# Altium project BLDC-Driver-v2.0.PrjPcb (part 4 of 4)

## Sheet BLDC-Driver-Sheet.SchDoc
size 420 x 297 mm; SheetNumber: 7; SheetTotal: 7
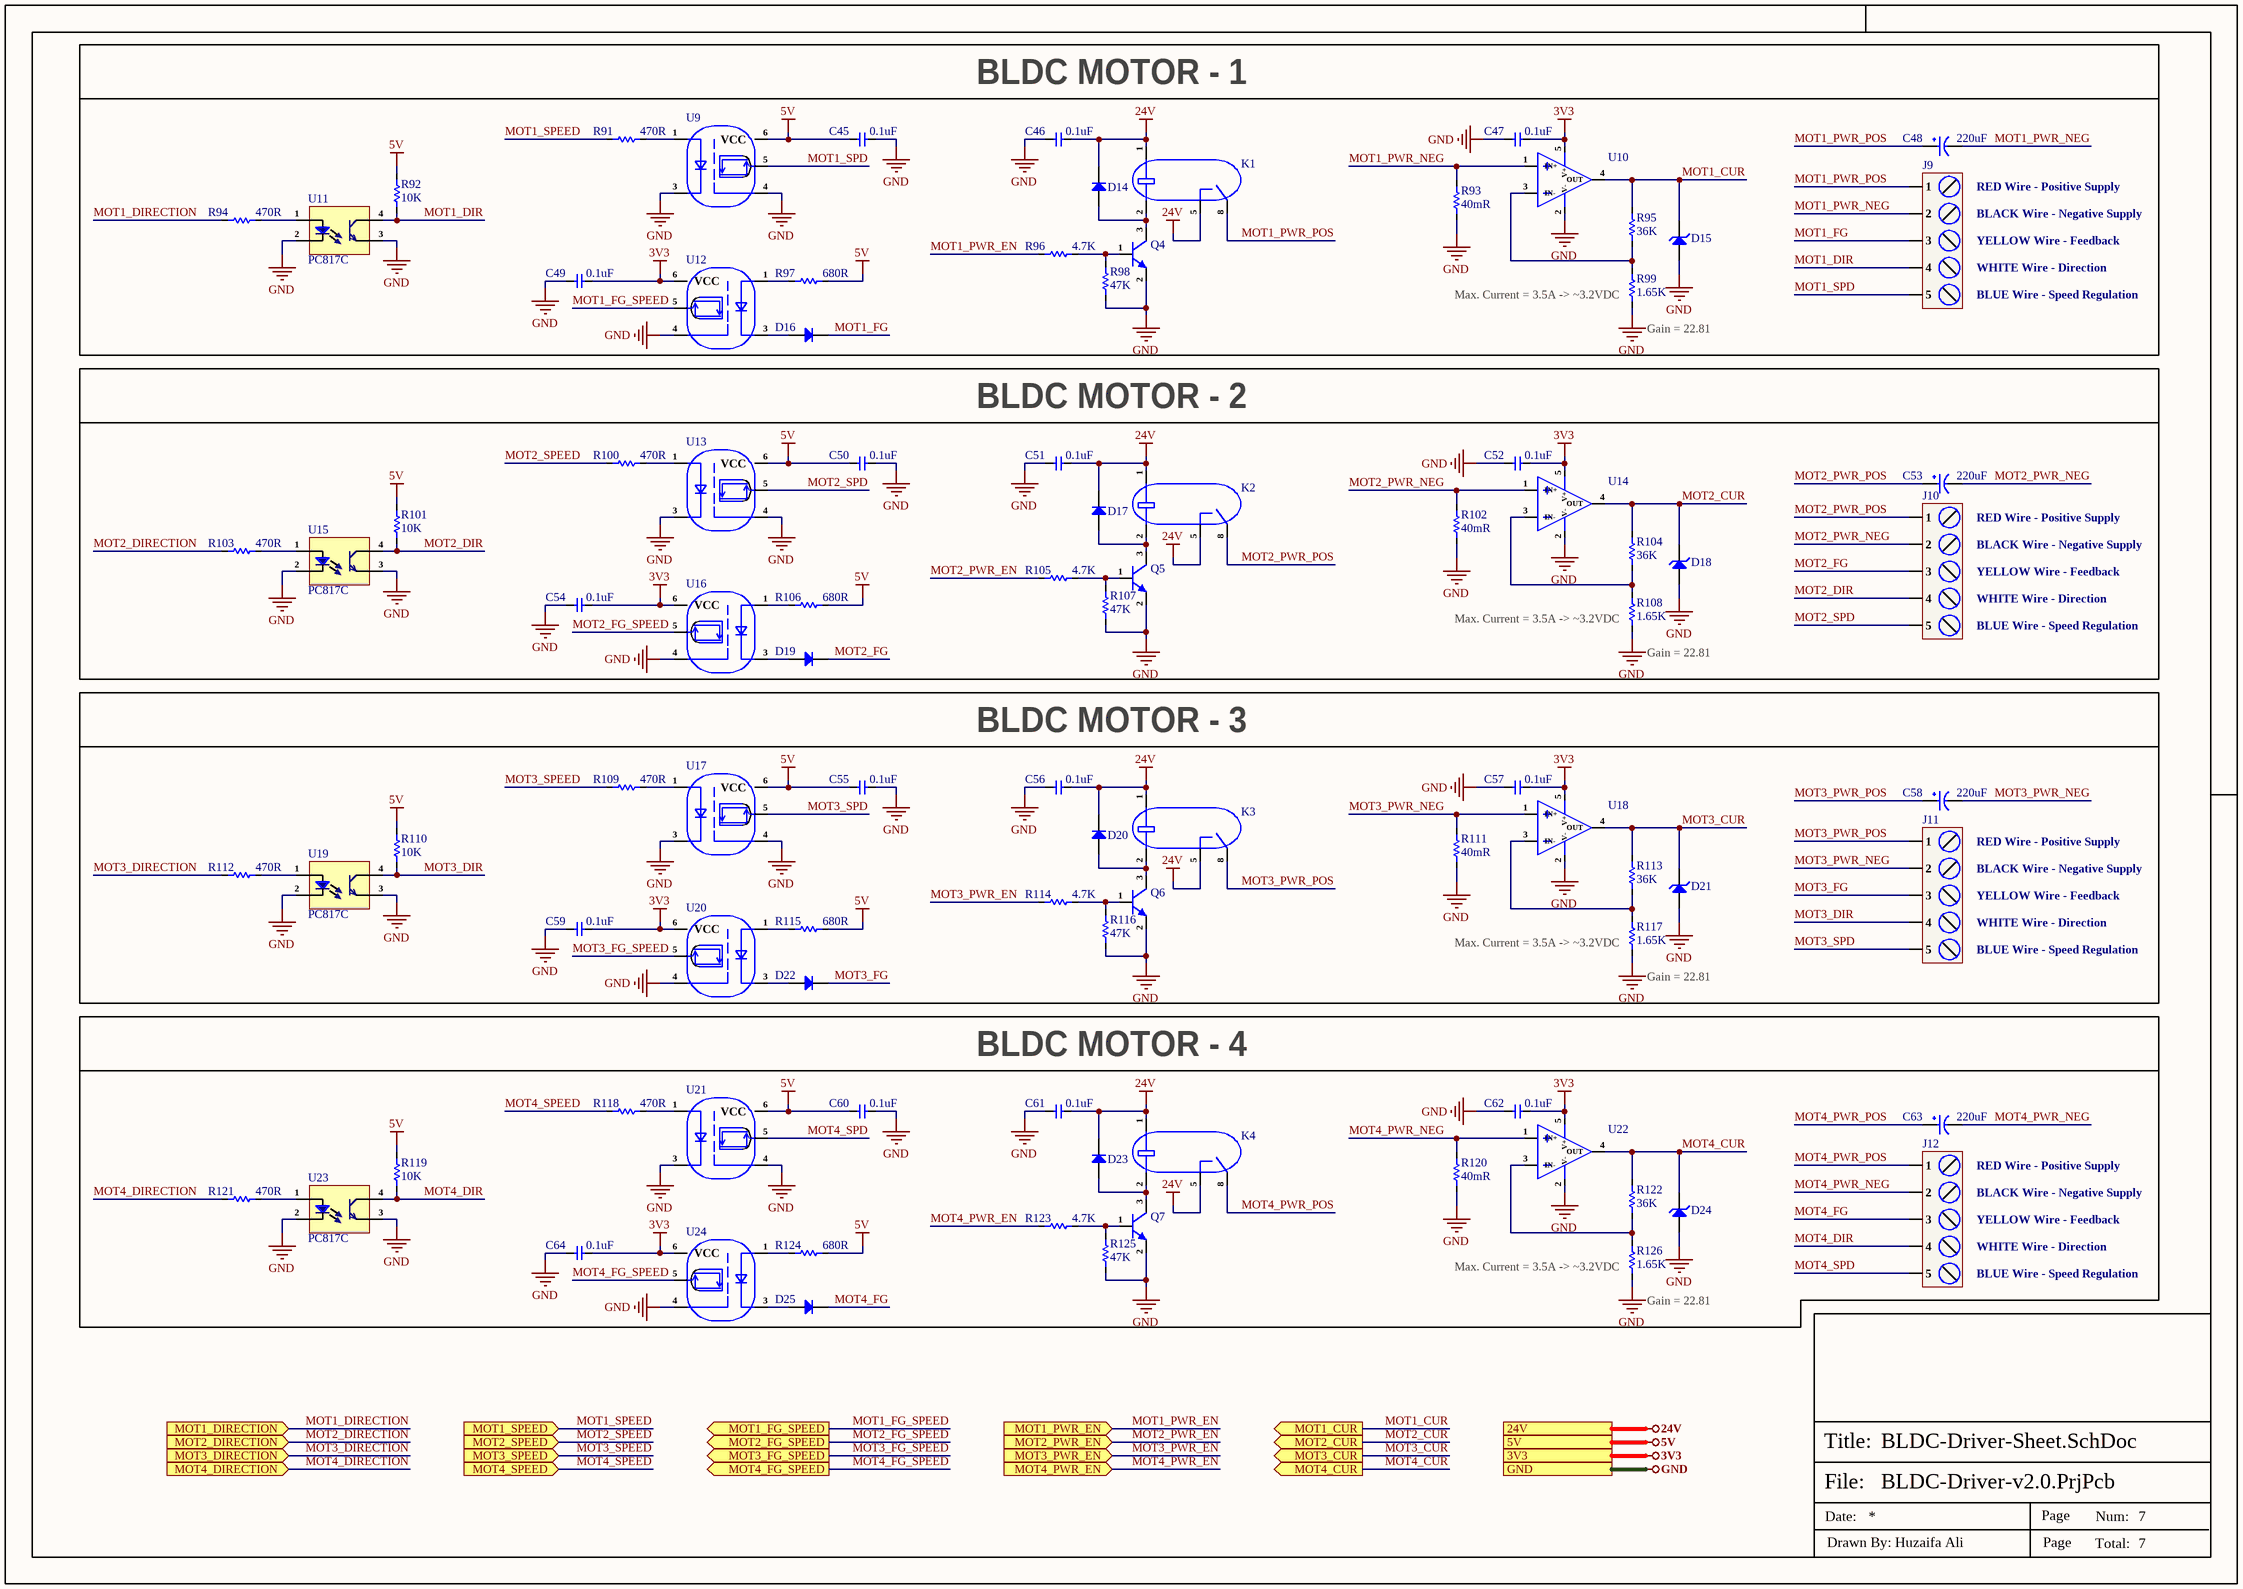
[diagram p6: BLDC-Driver-Sheet.SchDoc]

### Parts
C45  0.1uF  [Cap-0603]
C46  0.1uF  [Cap-0603]
C47  0.1uF  [Cap-0402]
C48  220uF  [SVZ1VM221FBRE00RAXXX]
C49  0.1uF  [Cap-0603]
C50  0.1uF  [Cap-0603]
C51  0.1uF  [Cap-0603]
C52  0.1uF  [Cap-0402]
C53  220uF  [SVZ1VM221FBRE00RAXXX]
C54  0.1uF  [Cap-0603]
C55  0.1uF  [Cap-0603]
C56  0.1uF  [Cap-0603]
C57  0.1uF  [Cap-0402]
C58  220uF  [SVZ1VM221FBRE00RAXXX]
C59  0.1uF  [Cap-0603]
C60  0.1uF  [Cap-0603]
C61  0.1uF  [Cap-0603]
C62  0.1uF  [Cap-0402]
C63  220uF  [SVZ1VM221FBRE00RAXXX]
C64  0.1uF  [Cap-0603]
D14  1N4148WS-7-F  [SOD-323]  (value not drawn)
D15  MM3Z3V3B  [SOD323F]  (value not drawn)
D16  1N4148WS-7-F  [SOD-323]  (value not drawn)
D17  1N4148WS-7-F  [SOD-323]  (value not drawn)
D18  MM3Z3V3B  [SOD323F]  (value not drawn)
D19  1N4148WS-7-F  [SOD-323]  (value not drawn)
D20  1N4148WS-7-F  [SOD-323]  (value not drawn)
D21  MM3Z3V3B  [SOD323F]  (value not drawn)
D22  1N4148WS-7-F  [SOD-323]  (value not drawn)
D23  1N4148WS-7-F  [SOD-323]  (value not drawn)
D24  MM3Z3V3B  [SOD323F]  (value not drawn)
D25  1N4148WS-7-F  [SOD-323]  (value not drawn)
J9  DB128V-5.08-5P-GN-S  [DB128V-5.08-5P-GN-S]  (value not drawn)
J10  DB128V-5.08-5P-GN-S  [DB128V-5.08-5P-GN-S]  (value not drawn)
J11  DB128V-5.08-5P-GN-S  [DB128V-5.08-5P-GN-S]  (value not drawn)
J12  DB128V-5.08-5P-GN-S  [DB128V-5.08-5P-GN-S]  (value not drawn)
K1  G6DN-1A-SLDC24  [G6DN-1A-SL DC24]  (value not drawn)
K2  G6DN-1A-SLDC24  [G6DN-1A-SL DC24]  (value not drawn)
K3  G6DN-1A-SLDC24  [G6DN-1A-SL DC24]  (value not drawn)
K4  G6DN-1A-SLDC24  [G6DN-1A-SL DC24]  (value not drawn)
Q4  MMBT3904T-7-F  [SOT-523]  (value not drawn)
Q5  MMBT3904T-7-F  [SOT-523]  (value not drawn)
Q6  MMBT3904T-7-F  [SOT-523]  (value not drawn)
Q7  MMBT3904T-7-F  [SOT-523]  (value not drawn)
R91  470R  [Res-0402]
R92  10K  [Res-0402]
R93  40mR  [Res-1206]
R94  470R  [Res-0402]
R95  36K  [Res-0402]
R96  4.7K  [Res-0402]
R97  680R  [Res-0402]
R98  47K  [Res-0402]
R99  1.65K  [Res-0402]
R100  470R  [Res-0402]
R101  10K  [Res-0402]
R102  40mR  [Res-1206]
R103  470R  [Res-0402]
R104  36K  [Res-0402]
R105  4.7K  [Res-0402]
R106  680R  [Res-0402]
R107  47K  [Res-0402]
R108  1.65K  [Res-0402]
R109  470R  [Res-0402]
R110  10K  [Res-0402]
R111  40mR  [Res-1206]
R112  470R  [Res-0402]
R113  36K  [Res-0402]
R114  4.7K  [Res-0402]
R115  680R  [Res-0402]
R116  47K  [Res-0402]
R117  1.65K  [Res-0402]
R118  470R  [Res-0402]
R119  10K  [Res-0402]
R120  40mR  [Res-1206]
R121  470R  [Res-0402]
R122  36K  [Res-0402]
R123  4.7K  [Res-0402]
R124  680R  [Res-0402]
R125  47K  [Res-0402]
R126  1.65K  [Res-0402]
U9  TLP2361(TPL,E(T  [SO-5]  (value not drawn)
U10  TLV9001IDCKR  [SC-70-5]  (value not drawn)
U11  PC817C  [PC817C]
U12  TLP2361(TPL,E(T  [SO-5]  (value not drawn)
U13  TLP2361(TPL,E(T  [SO-5]  (value not drawn)
U14  TLV9001IDCKR  [SC-70-5]  (value not drawn)
U15  PC817C  [PC817C]
U16  TLP2361(TPL,E(T  [SO-5]  (value not drawn)
U17  TLP2361(TPL,E(T  [SO-5]  (value not drawn)
U18  TLV9001IDCKR  [SC-70-5]  (value not drawn)
U19  PC817C  [PC817C]
U20  TLP2361(TPL,E(T  [SO-5]  (value not drawn)
U21  TLP2361(TPL,E(T  [SO-5]  (value not drawn)
U22  TLV9001IDCKR  [SC-70-5]  (value not drawn)
U23  PC817C  [PC817C]
U24  TLP2361(TPL,E(T  [SO-5]  (value not drawn)

### Blocks framed on the sheet
BLDC MOTOR - 1: C45-C49 D14-D16 J9 K1 Q4 R91-R99 U9-U12
BLDC MOTOR - 2: C50-C54 D17-D19 J10 K2 Q5 R100-R108 U13-U16
BLDC MOTOR - 3: C55-C59 D20-D22 J11 K3 Q6 R109-R117 U17-U20
BLDC MOTOR - 4: C60-C64 D23-D25 J12 K4 Q7 R118-R126 U21-U24

### Ports
3V3 (see Top-Sheet[1B], Comms-Sheet[4D], Controller-Sheet-1[4D], Controller-Sheet-2[4D], Power-Sheet[4D], USB-Sheet[4D]), 5V (see Top-Sheet[1B], Comms-Sheet[4D], Controller-Sheet-2[4D], Power-Sheet[4D], USB-Sheet[4D]), 24V (see Top-Sheet[1B], Power-Sheet[4D]), GND (see Top-Sheet[1B], Comms-Sheet[4D], Controller-Sheet-1[4D], Controller-Sheet-2[4D], Power-Sheet[4D], USB-Sheet[4D]), MOT1_CUR (out, see Top-Sheet[2B]), MOT1_DIRECTION (in, see Top-Sheet[2B]), MOT1_FG_SPEED (out, see Top-Sheet[2B]), MOT1_PWR_EN (in, see Top-Sheet[2B]), MOT1_SPEED (in, see Top-Sheet[2B]), MOT2_CUR (out, see Top-Sheet[2B]), MOT2_DIRECTION (in, see Top-Sheet[2B]), MOT2_FG_SPEED (out, see Top-Sheet[2B]), MOT2_PWR_EN (in, see Top-Sheet[2B]), MOT2_SPEED (in, see Top-Sheet[2B]), MOT3_CUR (out, see Top-Sheet[2B]), MOT3_DIRECTION (in, see Top-Sheet[2B]), MOT3_FG_SPEED (out, see Top-Sheet[2B]), MOT3_PWR_EN (in, see Top-Sheet[2B]), MOT3_SPEED (in, see Top-Sheet[2B]), MOT4_CUR (out, see Top-Sheet[2B]), MOT4_DIRECTION (in, see Top-Sheet[2B]), MOT4_FG_SPEED (out, see Top-Sheet[2B]), MOT4_PWR_EN (in, see Top-Sheet[2B]), MOT4_SPEED (in, see Top-Sheet[2B])

### Nets
3V3: C47.1 C49.1 C52.1 C54.1 C57.1 C59.1 C62.1 C64.1 U10.5(V+) U12.6(VCC) U14.5(V+) U16.6(VCC) U18.5(V+) U20.6(VCC) U22.5(V+) U24.6(VCC) ; port 3V3
5V: C45.1 C50.1 C55.1 C60.1 R92.2 R97.2 R101.2 R106.2 R110.2 R115.2 R119.2 R124.2 U9.6(VCC) U13.6(VCC) U17.6(VCC) U21.6(VCC) ; port 5V
24V: C46.1 C51.1 C56.1 C61.1 D14.1(K) D17.1(K) D20.1(K) D23.1(K) K1.1 K1.5 K2.1 K2.5 K3.1 K3.5 K4.1 K4.5 ; port 24V
GND: C45.2 C46.2 C47.2 C49.2 C50.2 C51.2 C52.2 C54.2 C55.2 C56.2 C57.2 C59.2 C60.2 C61.2 C62.2 C64.2 D15.1(A) D18.1(A) D21.1(A) D24.1(A) Q4.2(E) Q5.2(E) Q6.2(E) Q7.2(E) R93.1 R98.1 R99.1 R102.1 R107.1 R108.1 R111.1 R116.1 R117.1 R120.1 R125.1 R126.1 U9.3(CAT) U9.4(GND) U10.2(V-) U11.2(Ca) U11.3(E) U12.4(GND) U13.3(CAT) U13.4(GND) U14.2(V-) U15.2(Ca) U15.3(E) U16.4(GND) U17.3(CAT) U17.4(GND) U18.2(V-) U19.2(Ca) U19.3(E) U20.4(GND) U21.3(CAT) U21.4(GND) U22.2(V-) U23.2(Ca) U23.3(E) U24.4(GND) ; port GND
MOT1_CUR: D15.2(K) R95.2 U10.4(OUT) ; port MOT1_CUR  [project net ADC_PA3]
MOT1_DIR: J9.4 R92.1 U11.4(C)
MOT1_DIRECTION: R94.1 ; port MOT1_DIRECTION  [project net DO_PD2]
MOT1_FG: D16.1(K) J9.3
MOT1_FG_SPEED: U12.5(VO) ; port MOT1_FG_SPEED  [project net DI_PC0]
MOT1_PWR_EN: R96.1 ; port MOT1_PWR_EN  [project net DO_PA7]
MOT1_PWR_NEG: C48.2 J9.2 R93.2 U10.1(IN+)
MOT1_PWR_POS: C48.1 J9.1 K1.8
MOT1_SPD: J9.5 U9.5(VO)
MOT1_SPEED: R91.1 ; port MOT1_SPEED
MOT2_CUR: D18.2(K) R104.2 U14.4(OUT) ; port MOT2_CUR  [project net ADC_PA4]
MOT2_DIR: J10.4 R101.1 U15.4(C)
MOT2_DIRECTION: R103.1 ; port MOT2_DIRECTION  [project net DO_PB6]
MOT2_FG: D19.1(K) J10.3
MOT2_FG_SPEED: U16.5(VO) ; port MOT2_FG_SPEED  [project net DI_PC1]
MOT2_PWR_EN: R105.1 ; port MOT2_PWR_EN  [project net DO_PA8]
MOT2_PWR_NEG: C53.2 J10.2 R102.2 U14.1(IN+)
MOT2_PWR_POS: C53.1 J10.1 K2.8
MOT2_SPD: J10.5 U13.5(VO)
MOT2_SPEED: R100.1 ; port MOT2_SPEED
MOT3_CUR: D21.2(K) R113.2 U18.4(OUT) ; port MOT3_CUR  [project net ADC_PA5]
MOT3_DIR: J11.4 R110.1 U19.4(C)
MOT3_DIRECTION: R112.1 ; port MOT3_DIRECTION  [project net DO_PB7]
MOT3_FG: D22.1(K) J11.3
MOT3_FG_SPEED: U20.5(VO) ; port MOT3_FG_SPEED  [project net DI_PC2]
MOT3_PWR_EN: R114.1 ; port MOT3_PWR_EN  [project net DO_PC10]
MOT3_PWR_NEG: C58.2 J11.2 R111.2 U18.1(IN+)
MOT3_PWR_POS: C58.1 J11.1 K3.8
MOT3_SPD: J11.5 U17.5(VO)
MOT3_SPEED: R109.1 ; port MOT3_SPEED
MOT4_CUR: D24.2(K) R122.2 U22.4(OUT) ; port MOT4_CUR  [project net ADC_PA6]
MOT4_DIR: J12.4 R119.1 U23.4(C)
MOT4_DIRECTION: R121.1 ; port MOT4_DIRECTION  [project net DO_PB8]
MOT4_FG: D25.1(K) J12.3
MOT4_FG_SPEED: U24.5(VO) ; port MOT4_FG_SPEED  [project net DI_PC3]
MOT4_PWR_EN: R123.1 ; port MOT4_PWR_EN  [project net DO_PC11]
MOT4_PWR_NEG: C63.2 J12.2 R120.2 U22.1(IN+)
MOT4_PWR_POS: C63.1 J12.1 K4.8
MOT4_SPD: J12.5 U21.5(VO)
MOT4_SPEED: R118.1 ; port MOT4_SPEED  [project net LPTIM1_CH1_PC12]
NetD14_2: D14.2(A) K1.2 Q4.3(C)
NetD16_2: D16.2(A) U12.3(CAT)
NetD17_2: D17.2(A) K2.2 Q5.3(C)
NetD19_2: D19.2(A) U16.3(CAT)
NetD20_2: D20.2(A) K3.2 Q6.3(C)
NetD22_2: D22.2(A) U20.3(CAT)
NetD23_2: D23.2(A) K4.2 Q7.3(C)
NetD25_2: D25.2(A) U24.3(CAT)
NetQ4_1: Q4.1(B) R96.2 R98.2
NetQ5_1: Q5.1(B) R105.2 R107.2
NetQ6_1: Q6.1(B) R114.2 R116.2
NetQ7_1: Q7.1(B) R123.2 R125.2
NetR91_2: R91.2 U9.1(AN)
NetR94_2: R94.2 U11.1(An)
NetR95_1: R95.1 R99.2 U10.3(IN-)
NetR97_1: R97.1 U12.1(AN)
NetR100_2: R100.2 U13.1(AN)
NetR103_2: R103.2 U15.1(An)
NetR104_1: R104.1 R108.2 U14.3(IN-)
NetR106_1: R106.1 U16.1(AN)
NetR109_2: R109.2 U17.1(AN)
NetR112_2: R112.2 U19.1(An)
NetR113_1: R113.1 R117.2 U18.3(IN-)
NetR115_1: R115.1 U20.1(AN)
NetR118_2: R118.2 U21.1(AN)
NetR121_2: R121.2 U23.1(An)
NetR122_1: R122.1 R126.2 U22.3(IN-)
NetR124_1: R124.1 U24.1(AN)

### Notes on the sheet
- RED Wire - Positive Supply
- YELLOW Wire - Feedback
- WHITE Wire - Direction
- BLACK Wire - Negative Supply
- (near R99) Max. Current = 3.5A -> ~3.2VDC
- (near R99) Gain = 22.81
- BLUE Wire - Speed Regulation
- (near R108) Max. Current = 3.5A -> ~3.2VDC
- (near R108) Gain = 22.81
- (near R117) Max. Current = 3.5A -> ~3.2VDC
- (near R117) Gain = 22.81
- (near R126) Max. Current = 3.5A -> ~3.2VDC
- (near R126) Gain = 22.81
- File:
- Title:
- Date:
- Page
- Num:
- Total:
- Drawn By: Huzaifa Ali

### Library data of the parts
C45 C46 C49-C51 C54-C56 C59-C61 C64 = CL10B104KB8WPNC: CAP CER 0.1UF 50V X7R 0603; Item Type: Capacitor; Material: 4241ConductorMaterial; Value: 100nF; Tolerance: 10%; LCSC Part Number: C307348; ComponentLink1Description: LCSC; Supplier: Rs; Supplier Part Number: 2575919; RoHS: Yes; Category: Ceramic Capacitors; Stock: 400; Pricing: 100=0.021, 500=0.019, 1000=0.015, 2000=0.01 (GBP); Mounting Technology: Surface Mount; Case/Package: 0603; Case Code (Metric): 1608; Case Code (Imperial): 0603; Min Operating Temperature: -55°C; Max Operating Temperature: 125°C; Packaging: Cut Tape; Voltage Rating: 50V; Series: CL; Voltage Rating (DC): 50V; Height: 900um; Ratings: AEC-Q200; RoHS Compliant: Yes; Lead Free: 5697LeadFree; ComponentLink2URL: http://www.farnell.com/datasheets/2710560.pdf?src-supplier=Farnell; ComponentLink2Description: http://www.farnell.com/datasheets/2710560.pdf?src-supplier=Farnell; ComponentLink3URL: http://www.samsungsem.com/kr/support/product-search/mlcc/CL10B104KB8WPNC.jsp?src-supplier=Digi-Key; ComponentLink3Description: http://www.samsungsem.com/kr/support/product-search/mlcc/CL10B104KB8WPNC.jsp?src-supplier=Digi-Key; ComponentLink4URL: http://www.farnell.com/datasheets/2710560.pdf?src-supplier=Element14; ComponentLink4Description: http://www.farnell.com/datasheets/2710560.pdf?src-supplier=Element14; ComponentLink5URL: https://datasheet.octopart.com/CL10B104KB8WPNC-Samsung-Electro-Mechanics-datasheet-120093645.pdf?src-supplier=Future+Electronics; ComponentLink5Description: https://datasheet.octopart.com/CL10B104KB8WPNC-Samsung-Electro-Mechanics-datasheet-120093645.pdf?src-supplier=Future+Electronics; ComponentLink6URL: http://www.farnell.com/datasheets/2710560.pdf?src-supplier=Newark; ComponentLink6Description: http://www.farnell.com/datasheets/2710560.pdf?src-supplier=Newark; ComponentLink7URL: http://www.samsungsem.com/servlet/FileDownload?type=spec&file=CL10B104KB8WPNC.pdf&src-supplier=Avnet; ComponentLink7Description: http://www.samsungsem.com/servlet/FileDownload?type=spec&file=CL10B104KB8WPNC.pdf&src-supplier=Avnet; ComponentLink8URL: https://datasheet.octopart.com/CL10B104KB8WPNC-Samsung-datasheet-8326407.pdf?src-supplier=TME; ComponentLink8Description: https://datasheet.octopart.com/CL10B104KB8WPNC-Samsung-datasheet-8326407.pdf?src-supplier=TME
C47 C52 C57 C62 = CC0402JRX7R7BB104: CAP CER 0.1UF 16V X7R 0402; Manufacturer: Yageo; Material: 4241ConductorMaterial; Value: 100nF; Tolerance: 5%; Item Type: Capacitor; Supplier: Digikey; Supplier Part Number: 311-1676-1-ND; Manufacturer Part Number: CC0402JRX7R7BB104; RoHS: Yes; Category: Ceramic Capacitors; Stock: 1659111; Pricing: 1=0.1, 10=0.046, 50=0.0262, 100=0.0203, 500=0.01528, 1000=0.012, 2500=0.01091, 5000=0.01004 (USD); Mounting Technology: Surface Mount; Case/Package: 0402; Case Code (Metric): 1005; Case Code (Imperial): 0402; Min Operating Temperature: -55°C; Max Operating Temperature: 125°C; Dielectric: X7R; Packaging: Tape and Reel; Package Quantity: 10000; Voltage Rating (DC): 16V; Voltage Rating: 16V; Series: CC; Construction: Flat; Length: 0.039inch; Width: 0.02inch; Height: 0.5mm; Thickness: 0.022inch; Lead Free: Lead Free; Halogen Free: Halogen Free; RoHS Compliant: Yes; ComponentLink1URL: https://datasheet.ciiva.com/13210/upy-gphc-x7r-6-3v-to-50v-8-12304-13210152.pdf?src-supplier=Mouser; ComponentLink1Description: https://datasheet.ciiva.com/13210/upy-gphc-x7r-6-3v-to-50v-8-12304-13210152.pdf?src-supplier=Mouser; LCSC Part Number: C541464
C48 C53 C58 C63 = SVZ1VM221FBRE00RAXXX: 35V 220uF ±20% 30mΩ@100kHz 2.4A@100kHz SMD,D8xL11.5mm Polymer Aluminum Capacitors ROHS; Manufacturer: KNSCHA; Manufacturer Part Number: C2923769; Package: SMD,D8xL11.5mm; LCSC Part Number: C2923769; Item Type: Capacitor; ComponentLink1Description: LCSC; ComponentLink1URL: https://www.lcsc.com/product-detail/Polymer-Aluminum-Capacitors_AISHI-Aihua-Group-SVZ1VM221FBRE00RAXXX_C2923769.html
D14 D16 D17 D19 D20 D22 D23 D25 = 1N4148WS-7-F: DIODE GEN PURP 75V 150MA SOD323; Manufacturer: Diodes; Forward Current: 300mA; Reverse Recovery Time: 4ns; Element Configuration: Single; Forward Voltage: 1.25V; Max Reverse Current: 1uA; Peak Non-Repetitive Surge Current: 2A; Power Dissipation: 200mW; Polarity: Standard; Capacitance: 2pF; Supplier 1: Mouser; Manufacturer Part Number: 1N4148WS-7-F; RoHS: Yes; Category: Rectifier Diodes; Pricing 1: 1=0.19000, 10=0.17500, 50=0.17500, 100=0.09600, 500=0.05900, 1000=0.04000, 3000=0.03000, 9000=0.02600, 10000=0.02600, 24000=0.02300, 45000=0.01900 (USD); Mount: Surface Mount; Number of Pins: 2; Weight: 0.000173oz; Contact Plating: Tin,Matte; Min Operating Temperature: -65°C; Max Operating Temperature: 150°C; Max Repetitive Reverse Voltage (Vrrm): 75V; Max Forward Surge Current (Ifsm): 2A; Max Surge Current: 2A; Packaging: Tape and Reel; Recovery Time: 4ns; Package Quantity: 3000; Average Rectified Current: 150mA; Voltage Rating (DC): 75V; Power Rating: 200mW; Current Rating: 150mA; Output Current: 150mA; Voltage: 75V; Max Reverse Voltage (DC): 75V; Series: -; Reverse Recovery Time-Max: 4ns; Length: 1.8mm; Width: 1.4mm; Height: 1mm; Radiation Hardening: No; REACH SVHC: No SVHC; Lead Free: Lead Free; RoHS Compliant: Yes; ComponentLink1URL: https://datasheet.ciiva.com/1179/ds30097-1179355.pdf?src-supplier=Element14; ComponentLink1Description: https://datasheet.ciiva.com/1179/ds30097-1179355.pdf?src-supplier=Element14; ComponentLink2URL: https://datasheet.ciiva.com/8300/ds30097-8300396.pdf?src-supplier=Avnet; ComponentLink2Description: https://datasheet.ciiva.com/8300/ds30097-8300396.pdf?src-supplier=Avnet; ComponentLink3URL: https://datasheet.ciiva.com/16199/ds30097-16199061.pdf?src-supplier=Future+Electronics; ComponentLink3Description: https://datasheet.ciiva.com/16199/ds30097-16199061.pdf?src-supplier=Future+Electronics; ComponentLink4URL: https://datasheet.ciiva.com/911/ds30097-911742.pdf?src-supplier=Digi-Key; ComponentLink4Description: https://datasheet.ciiva.com/911/ds30097-911742.pdf?src-supplier=Digi-Key; ComponentLink5URL: https://datasheet.ciiva.com/911/ds30097-911743.pdf?src-supplier=Digi-Key; ComponentLink5Description: https://datasheet.ciiva.com/911/ds30097-911743.pdf?src-supplier=Digi-Key; ComponentLink6URL: https://datasheet.ciiva.com/911/ds30097-911741.pdf?src-supplier=Digi-Key; ComponentLink6Description: https://datasheet.ciiva.com/911/ds30097-911741.pdf?src-supplier=Digi-Key; Supplier Part Number 1: 621-1N4148WS-F; LCSC Part Number: C60580; Item Type: Diode
D15 D18 D21 D24 = MM3Z3V3B: DIODE ZENER 3.3V 200MW SOD323F; Manufacturer: ON Semiconductor / Fairchild; Forward Voltage: 1V; Tolerance: 2%; Impedance: 89R; Max Reverse Leakage Current: 4.5uA; Test Current: 5mA; Element Configuration: Single; Supplier 1: Digi-Key; Manufacturer Part Number: MM3Z3V3B; Stock 1: 473644; Pricing 1: 1=0.22, 10=0.18, 100=0.0956, 500=0.06288, 1000=0.04276 (USD); Mount: Surface Mount; Number of Pins: 2; Weight: 0.0276g; Min Operating Temperature: -65°C; Max Operating Temperature: 150°C; Packaging: Tape and Reel; Package Quantity: 1; Max Power Dissipation: 200mW; Zener Voltage: 3.3V; Voltage Tolerance: 2%; Power Dissipation: 200mW; Working Voltage: 3.3V; Peak Reverse Current: 4.5uA; Length: 1.3mm; Height: 1mm; Width: 1.7mm; Radiation Hardening: No; REACH SVHC: No SVHC; Lead Free: Lead Free; ComponentLink1URL: http://www.onsemi.com/pub/Collateral/MM3Z9V1B-D.pdf?src-supplier=Digi-Key; ComponentLink1Description: http://www.onsemi.com/pub/Collateral/MM3Z9V1B-D.pdf?src-supplier=Digi-Key; ComponentLink2URL: http://www.mouser.com/ds/2/149/MM3Z3V3B-187166.pdf?src-supplier=Mouser; ComponentLink2Description: http://www.mouser.com/ds/2/149/MM3Z3V3B-187166.pdf?src-supplier=Mouser; ComponentLink3URL: https://www.fairchildsemi.com/datasheets/MM/MM3Z9V1B.pdf?src-supplier=Avnet; ComponentLink3Description: https://www.fairchildsemi.com/datasheets/MM/MM3Z9V1B.pdf?src-supplier=Avnet; ComponentLink4URL: http://www.farnell.com/datasheets/1706525.pdf?src-supplier=Element14; ComponentLink4Description: http://www.farnell.com/datasheets/1706525.pdf?src-supplier=Element14; Supplier Part Number 1: MM3Z3V3BCT-ND; LCSC Part Number: C2978865; Item Type: Diode
J9-J12 = DB128V-5.08-5P-GN-S: 1x5P 20A -40℃~+105℃ 300V Green 12~30 Direct Insert 5.08mm 2.5 1 5 Plugin,P=5.08mm Screw Terminal Blocks ROHS; Manufacturer: DORABO; Manufacturer Part Number: DB128V-5.08-5P-GN-S; Package: Plugin,P=5.08mm; LCSC Part Number: C2927513; ComponentLink1Description: LCSC; ComponentLink1URL: https://www.lcsc.com/product-detail/Screw-Terminal-Blocks_DORABO-DB128V-5-08-5P-GN-S_C2927513.html; Item Type: Terminal Block
K1-K4 = G6DN-1A-SLDC24: RELAY GEN PURPOSE SPST 5A 24V; Manufacturer: Omron; Item Type: Power Relays; Supplier: Digikey; LCSC Part Number: C397209; Manufacturer Part Number: G6DN-1A-SLDC24; RoHS: No; Stock: 457; Pricing: 1=2.37, 10=2.078, 25=2.068, 40=1.8325, 100=1.519, 300=1.47, 500=1.41912 (USD); ComponentLink1URL: http://datasheet.octopart.com/G6DN-1A-SL-DC24-Omron-datasheet-138102761.pdf?src-supplier=Rs; ComponentLink1Description: http://datasheet.octopart.com/G6DN-1A-SL-DC24-Omron-datasheet-138102761.pdf?src-supplier=Rs; ComponentLink2URL: http://datasheet.octopart.com/G6DN-1A-SL-DC24-Omron-datasheet-138102761.pdf?src-supplier=Newark; ComponentLink2Description: http://datasheet.octopart.com/G6DN-1A-SL-DC24-Omron-datasheet-138102761.pdf?src-supplier=Newark; ComponentLink3URL: http://datasheet.octopart.com/G6DN-1A-SL-DC24-Omron-datasheet-138102761.pdf?src-supplier=Mouser; ComponentLink3Description: http://datasheet.octopart.com/G6DN-1A-SL-DC24-Omron-datasheet-138102761.pdf?src-supplier=Mouser; ComponentLink4URL: http://datasheet.octopart.com/G6DN-1A-SL-DC24-Omron-datasheet-138102761.pdf?src-supplier=Allied+Electronics; ComponentLink4Description: http://datasheet.octopart.com/G6DN-1A-SL-DC24-Omron-datasheet-138102761.pdf?src-supplier=Allied+Electronics; ComponentLink5URL: http://datasheet.octopart.com/G6DN-1A-SL-DC24-Omron-datasheet-138102761.pdf?src-supplier=Farnell; ComponentLink5Description: http://datasheet.octopart.com/G6DN-1A-SL-DC24-Omron-datasheet-138102761.pdf?src-supplier=Farnell; ComponentLink6URL: http://datasheet.octopart.com/G6DN-1A-SL-DC24-Omron-datasheet-138102761.pdf?src-supplier=Digikey; ComponentLink6Description: http://datasheet.octopart.com/G6DN-1A-SL-DC24-Omron-datasheet-138102761.pdf?src-supplier=Digikey; ComponentLink7URL: http://datasheet.octopart.com/G6DN-1A-SL-DC24-Omron-datasheet-138102761.pdf?src-supplier=Sager+Electronics; ComponentLink7Description: http://datasheet.octopart.com/G6DN-1A-SL-DC24-Omron-datasheet-138102761.pdf?src-supplier=Sager+Electronics
Q4-Q7 = MMBT3904T-7-F: TRANS NPN 40V 0.2A SOT523; Manufacturer: Diodes Zetex; Item Type: Transistor; Supplier: Future Electronics; Supplier Part Number: 4140292; Manufacturer Part Number: MMBT3904T-7-F; RoHS: Yes; Category: BJTs; Stock: 36000; Pricing: 3000=0.0261, 9000=0.0252, 15000=0.0248, 60000=0.0236, 90000=0.0229 (USD); ComponentLink1URL: https://datasheet.ciiva.com/15139/getdatasheetpartid-142850-15139485.pdf?src-supplier=Verical; ComponentLink1Description: https://datasheet.ciiva.com/15139/getdatasheetpartid-142850-15139485.pdf?src-supplier=Verical; ComponentLink2URL: https://datasheet.ciiva.com/11199/ds30270-11199009.pdf?src-supplier=Avnet; ComponentLink2Description: https://datasheet.ciiva.com/11199/ds30270-11199009.pdf?src-supplier=Avnet; ComponentLink3URL: https://datasheet.ciiva.com/17053/0900766b80e49818-17053736.pdf?src-supplier=Allied+Electronics; ComponentLink3Description: https://datasheet.ciiva.com/17053/0900766b80e49818-17053736.pdf?src-supplier=Allied+Electronics; ComponentLink4URL: https://datasheet.ciiva.com/8029/ds30270-8029717.pdf?src-supplier=Element14; ComponentLink4Description: https://datasheet.ciiva.com/8029/ds30270-8029717.pdf?src-supplier=Element14; ComponentLink5URL: https://datasheet.ciiva.com/22711/480146-22711751.pdf?src-supplier=Element14; ComponentLink5Description: https://datasheet.ciiva.com/22711/480146-22711751.pdf?src-supplier=Element14; ComponentLink6URL: https://datasheet.ciiva.com/4723/ds30270-4723401.pdf?src-supplier=Mouser; ComponentLink6Description: https://datasheet.ciiva.com/4723/ds30270-4723401.pdf?src-supplier=Mouser; ComponentLink7URL: https://datasheet.ciiva.com/6360/ds30270-6360919.pdf?src-supplier=Digikey; ComponentLink7Description: https://datasheet.ciiva.com/6360/ds30270-6360919.pdf?src-supplier=Digikey; LCSC Part Number: C239187
R91 R94 R100 R103 R109 R112 R118 R121 = RC0402FR-07470RL: RES 470 OHM 1% 1/16W 0402; Manufacturer: Yageo; Item Type: Resistor; Voltage Rating: 50V; Power Rating: 62.5mW; Temperature Coefficient: 100ppm/°C; Max Power Dissipation: 63mW; Supplier: Avnet; Supplier Part Number: RC0402FR-07470RL; Manufacturer Part Number: RC0402FR-07470RL; RoHS: Yes; Stock: 10000; Pricing: 10000=0.00085 (USD); Case/Package: 0402; Case Code (Metric): 1005; Case Code (Imperial): 0402; Min Operating Temperature: -55°C; Max Operating Temperature: 155°C; Packaging: Tape and Reel; Value: 470R; Tolerance: 1%; Number of Terminations: 2; Working Voltage: 50V; Package Quantity: 1; Resistor Type: Thick Film; Termination: SMD/SMT; Features: Moisture Resistant; Series: RC; Resistance Tolerance: 1%; Construction: Rectangular; Voltage Rating (AC): 50V; Length: 1mm; Width: 0.02inch; Height: 0.016inch; Depth: 0.5mm; Lead Free: Lead Free; Reach SVHC Compliant: No; RoHS Compliant: Yes; Military Standard: Not; ComponentLink1URL: https://datasheet.ciiva.com/46412/1018594-46412838.pdf?src-supplier=Element14; ComponentLink1Description: https://datasheet.ciiva.com/46412/1018594-46412838.pdf?src-supplier=Element14; ComponentLink2URL: https://datasheet.ciiva.com/2453/pyu-r-int-thick-7-2453377.pdf?src-supplier=Digikey; ComponentLink2Description: https://datasheet.ciiva.com/2453/pyu-r-int-thick-7-2453377.pdf?src-supplier=Digikey; ComponentLink3URL: https://datasheet.ciiva.com/2453/pyu-r-int-thick-7-2453378.pdf?src-supplier=Digikey; ComponentLink3Description: https://datasheet.ciiva.com/2453/pyu-r-int-thick-7-2453378.pdf?src-supplier=Digikey; ComponentLink4URL: https://datasheet.ciiva.com/2453/pyu-r-int-thick-7-2453376.pdf?src-supplier=Digikey; ComponentLink4Description: https://datasheet.ciiva.com/2453/pyu-r-int-thick-7-2453376.pdf?src-supplier=Digikey; ComponentLink5URL: https://datasheet.ciiva.com/7850/1018594-7850015.pdf?src-supplier=Element14; ComponentLink5Description: https://datasheet.ciiva.com/7850/1018594-7850015.pdf?src-supplier=Element14; ComponentLink6URL: https://datasheet.ciiva.com/7850/1018594-7850014.pdf?src-supplier=Element14; ComponentLink6Description: https://datasheet.ciiva.com/7850/1018594-7850014.pdf?src-supplier=Element14; ComponentLink7URL: https://datasheet.ciiva.com/15189/getdatasheetpartid-330246-15189463.pdf?src-supplier=Verical; ComponentLink7Description: https://datasheet.ciiva.com/15189/getdatasheetpartid-330246-15189463.pdf?src-supplier=Verical; LCSC Part Number: C114877
R92 R101 R110 R119 = RC0402FR-0710KL: RES 10K OHM 1% 1/16W 0402; Manufacturer: Yageo; Resistance: 10kR; Voltage Rating (DC): 50V; Temperature Coefficient: 100ppm/°C; Power Rating: 62.5mW; Max Power Dissipation: 63mW; Item Type: Resistor; Supplier 1: Mouser; Manufacturer Part Number: RC0402FR-0710KL; RoHS: Yes; Category: Chip SMD Resistors; Stock 1: 18648329; Pricing 1: 1=0.10000, 10=0.01400, 50=0.01400, 100=0.00500, 1000=0.00300, 10000=0.00200 (USD); Case/Package: 0402; Number of Pins: 2; Case Code (Imperial): 0402; Case Code (Metric): 1005; Min Operating Temperature: -55°C; Max Operating Temperature: 155°C; Resistor Type: Thick Film; Tolerance: 1%; Packaging: Tape and Reel; Voltage Rating: 50V; Termination: SMD/SMT; Working Voltage: 50V; Number of Terminations: 2; Features: Moisture Resistant; Series: RC; Resistance Tolerance: 1%; Construction: Rectangular; Length: 1mm; Width: 0.5mm; Height: 0.32mm; Depth: 0.5mm; Lead Pitch: 0.2mm; REACH SVHC: No SVHC; Lead Free: Lead Free; RoHS Compliant: Yes; Military Standard: Not; ComponentLink1URL: https://datasheet.ciiva.com/7660/38568-7660787.pdf?src-supplier=Element14; ComponentLink1Description: https://datasheet.ciiva.com/7660/38568-7660787.pdf?src-supplier=Element14; ComponentLink2URL: https://datasheet.ciiva.com/7849/1686128-7849814.pdf?src-supplier=Element14; ComponentLink2Description: https://datasheet.ciiva.com/7849/1686128-7849814.pdf?src-supplier=Element14; ComponentLink3URL: https://datasheet.ciiva.com/7983/1018594-7983486.pdf?src-supplier=Element14; ComponentLink3Description: https://datasheet.ciiva.com/7983/1018594-7983486.pdf?src-supplier=Element14; ComponentLink4URL: https://datasheet.ciiva.com/22747/1018594-22747512.pdf?src-supplier=Element14; ComponentLink4Description: https://datasheet.ciiva.com/22747/1018594-22747512.pdf?src-supplier=Element14; ComponentLink5URL: https://datasheet.ciiva.com/12667/pyu-rc0402-51-rohs-l-6-r-12667067.pdf?src-supplier=Mouser; ComponentLink5Description: https://datasheet.ciiva.com/12667/pyu-rc0402-51-rohs-l-6-r-12667067.pdf?src-supplier=Mouser; ComponentLink6URL: https://datasheet.ciiva.com/7849/1784430-7849813.pdf?src-supplier=Element14; ComponentLink6Description: https://datasheet.ciiva.com/7849/1784430-7849813.pdf?src-supplier=Element14; ComponentLink7URL: https://datasheet.ciiva.com/7849/1784430-7849815.pdf?src-supplier=Element14; ComponentLink7Description: https://datasheet.ciiva.com/7849/1784430-7849815.pdf?src-supplier=Element14; Supplier Part Number 1: 603-RC0402FR-0710KL; LCSC Part Number: C60490
R93 R102 R111 R120 = LR1206-21R040F4: 1W 40mΩ Surface Mount Current Sensing Resistors ±50ppm/℃ ±1% 1206 Current Sense Resistors/Shunt Resistors ROHS; Manufacturer: RALEC; Manufacturer Part Number: LR1206-21R040F4; Package: 1206; LCSC Part Number: C2681030; Item Type: Resistor; ComponentLink1Description: LCSC; ComponentLink1URL: https://www.lcsc.com/product-detail/Current-Sense-Resistors-Shunt-Resistors_RALEC-LR1206-21R040F4_C2681030.html
R95 R104 R113 R122 = RT0402BRD0736KL: RES SMD 36K OHM 0.1% 1/16W 0402; Manufacturer: Yageo; Voltage Rating: 50V; Value: 36kR; Power Rating: 62.5mW; Max Power Dissipation: 63mW; Temperature Coefficient: 25ppm/°C; Item Type: Resistor; Supplier: Arrow Electronics; Supplier Part Number: RT0402BRD0736KL; Manufacturer Part Number: RT0402BRD0736KL; RoHS: Yes; Category: Chip SMD Resistors; Stock: 6118; Pricing: 1=0.3205, 10=0.2411, 25=0.2387, 100=0.1111, 250=0.1093, 500=0.0738, 1000=0.0507, 3000=0.0463, 6000=0.0439 (USD); Case/Package: 0402; Case Code (Metric): 1005; Case Code (Imperial): 0402; Min Operating Temperature: -55°C; Max Operating Temperature: 155°C; Tolerance: 0.1%; Packaging: Tape and Reel; Number of Terminations: 2; Termination: SMD/SMT; Voltage Rating (DC): 50V; Features: Moisture Resistant; Series: RT; Length: 0.039inch; Width: 0.02inch; Height: 0.014inch; Lead Free: Lead Free; RoHS Compliant: Yes; ComponentLink1URL: https://datasheet.ciiva.com/12722/pyu-rt-1-to-0-05-rohs-l-4-12722329.pdf?src-supplier=Mouser; ComponentLink1Description: https://datasheet.ciiva.com/12722/pyu-rt-1-to-0-05-rohs-l-4-12722329.pdf?src-supplier=Mouser; LCSC Part Number: C852742
R96 R105 R114 R123 = RC0402FR-074K7L: RES 4.7K OHM 1% 1/16W 0402; Manufacturer: Yageo; Voltage Rating (DC): 50V; Power Rating: 62.5mW; Resistance: 4.7kR; Temperature Coefficient: 100ppm/°C; Max Power Dissipation: 63mW; Item Type: Resistor; Supplier 1: Avnet; Manufacturer Part Number: RC0402FR-074K7L; RoHS: Yes; Category: Chip SMD Resistors; Stock 1: 2420000; Pricing 1: 10000=0.00085 (USD); Case/Package: 0402; Number of Pins: 2; Case Code (Imperial): 0402; Case Code (Metric): 1005; Size Code: 0402; Min Operating Temperature: -55°C; Max Operating Temperature: 155°C; Tolerance: 1%; Voltage Rating: 50V; Packaging: Tape and Reel; Resistor Type: Thick Film; Termination: SMD/SMT; Features: Moisture Resistant; Series: RC; Number of Terminations: 2; Resistance Tolerance: 1%; Construction: Rectangular; Length: 1mm; Width: 0.5mm; Height: 0.32mm; Depth: 0.5mm; Height - Seated (Max): 0.016inch; RoHS Compliant: Yes; Reach SVHC Compliant: Yes; Military Standard: Not; Lead Free: Lead Free; ComponentLink1URL: https://datasheet.ciiva.com/22661/1686128-22661342.pdf?src-supplier=Element14; ComponentLink1Description: https://datasheet.ciiva.com/22661/1686128-22661342.pdf?src-supplier=Element14; ComponentLink2URL: https://datasheet.ciiva.com/7850/1018594-7850022.pdf?src-supplier=Element14; ComponentLink2Description: https://datasheet.ciiva.com/7850/1018594-7850022.pdf?src-supplier=Element14; ComponentLink3URL: https://datasheet.ciiva.com/7850/1018594-7850023.pdf?src-supplier=Element14; ComponentLink3Description: https://datasheet.ciiva.com/7850/1018594-7850023.pdf?src-supplier=Element14; ComponentLink4URL: https://datasheet.ciiva.com/15215/getdatasheetpartid-328119-15215035.pdf?src-supplier=Verical; ComponentLink4Description: https://datasheet.ciiva.com/15215/getdatasheetpartid-328119-15215035.pdf?src-supplier=Verical; Supplier Part Number 1: RC0402FR-074K7L; LCSC Part Number: C105871
R97 R106 R115 R124 = RC0402FR-07680RL: RES 680 OHM 1% 1/16W 0402; Manufacturer: Yageo; Temperature Coefficient: 100ppm/°C; Power Rating: 63mW; Voltage Rating: 50V; Item Type: Resistor; Supplier 1: Future Electronics; Manufacturer Part Number: RC0402FR-07680RL; RoHS: Yes; Category: Chip SMD Resistors; Stock 1: 5080000; Pricing 1: 10000=0.0011, 100000=0.0011, 300000=0.001, 750000=0.001, 2000000=0.0009 (USD); Case/Package: 0402; Case Code (Imperial): 0402; Case Code (Metric): 1005; Size Code: 0402; Min Operating Temperature: -55°C; Max Operating Temperature: 155°C; Resistance: 680R; Tolerance: 1%; Packaging: Tape and Reel; Resistor Type: Thick Film; Termination: SMD/SMT; Features: Moisture Resistant; Series: RC; Max Power Dissipation: 63mW; Number of Terminations: 2; Resistance Tolerance: 1%; Construction: Rectangular; Voltage Rating (AC): 50V; Length: 1mm; Depth: 0.5mm; Reach SVHC Compliant: No; Lead Free: Lead Free; Military Standard: Not; RoHS Compliant: Yes; ComponentLink1URL: https://datasheet.ciiva.com/12667/pyu-rc0402-51-rohs-l-6-r-12667916.pdf?src-supplier=Mouser; ComponentLink1Description: https://datasheet.ciiva.com/12667/pyu-rc0402-51-rohs-l-6-r-12667916.pdf?src-supplier=Mouser; ComponentLink2URL: https://datasheet.ciiva.com/7850/1018594-7850071.pdf?src-supplier=Element14; ComponentLink2Description: https://datasheet.ciiva.com/7850/1018594-7850071.pdf?src-supplier=Element14; ComponentLink3URL: https://datasheet.ciiva.com/7850/1018594-7850070.pdf?src-supplier=Element14; ComponentLink3Description: https://datasheet.ciiva.com/7850/1018594-7850070.pdf?src-supplier=Element14; ComponentLink4URL: https://datasheet.ciiva.com/17042/pyu-rc0402-51-rohs-l-6-r-17042399.pdf?src-supplier=Future+Electronics; ComponentLink4Description: https://datasheet.ciiva.com/17042/pyu-rc0402-51-rohs-l-6-r-17042399.pdf?src-supplier=Future+Electronics; Supplier Part Number 1: 7948052
R98 R107 R116 R125 = RC0402FR-0747KL: RES 47K OHM 1% 1/16W 0402; Manufacturer: Yageo; Power Rating: 62.5mW; Temperature Coefficient: 100ppm/°C; Voltage Rating: 50V; Resistance: 47kR; Max Power Dissipation: 63mW; Item Type: Resistor; Supplier 1: Avnet; Manufacturer Part Number: RC0402FR-0747KL; RoHS: Yes; Category: Chip SMD Resistors; Stock 1: 680000; Pricing 1: 10000=0.00085, 20000=0.00087, 40000=0.00084, 60000=0.00083, 80000=0.00079, 100000=0.00078, 1000000=0.00076 (USD); Case/Package: 0402; Case Code (Imperial): 0402; Case Code (Metric): 1005; Size Code: 0402; Min Operating Temperature: -55°C; Max Operating Temperature: 155°C; Tolerance: 1%; Series: RC; Packaging: Tape and Reel; Package Quantity: 1; Termination: SMD/SMT; Resistor Type: Thick Film; Number of Terminations: 2; Features: Moisture Resistant; Resistance Tolerance: 1%; Construction: Rectangular; Length: 1mm; Width: 0.02inch; Height: 0.016inch; Depth: 0.5mm; RoHS Compliant: Yes; Military Standard: Not; Lead Free: Lead Free; ComponentLink1URL: https://datasheet.ciiva.com/46412/1018594-46412839.pdf?src-supplier=Element14; ComponentLink1Description: https://datasheet.ciiva.com/46412/1018594-46412839.pdf?src-supplier=Element14; ComponentLink2URL: https://datasheet.ciiva.com/2453/pyu-r-int-thick-7-2453389.pdf?src-supplier=Digi-Key; ComponentLink2Description: https://datasheet.ciiva.com/2453/pyu-r-int-thick-7-2453389.pdf?src-supplier=Digi-Key; ComponentLink3URL: https://datasheet.ciiva.com/2453/pyu-r-int-thick-7-2453390.pdf?src-supplier=Digi-Key; ComponentLink3Description: https://datasheet.ciiva.com/2453/pyu-r-int-thick-7-2453390.pdf?src-supplier=Digi-Key; ComponentLink4URL: https://datasheet.ciiva.com/2453/pyu-r-int-thick-7-2453388.pdf?src-supplier=Digi-Key; ComponentLink4Description: https://datasheet.ciiva.com/2453/pyu-r-int-thick-7-2453388.pdf?src-supplier=Digi-Key; ComponentLink5URL: https://datasheet.ciiva.com/15189/getdatasheetpartid-323748-15189466.pdf?src-supplier=Verical; ComponentLink5Description: https://datasheet.ciiva.com/15189/getdatasheetpartid-323748-15189466.pdf?src-supplier=Verical; ComponentLink6URL: https://datasheet.ciiva.com/16793/pyu-rc0402-51-rohs-l-6-r-16793430.pdf?src-supplier=Future+Electronics; ComponentLink6Description: https://datasheet.ciiva.com/16793/pyu-rc0402-51-rohs-l-6-r-16793430.pdf?src-supplier=Future+Electronics; Supplier Part Number 1: RC0402FR-0747KL; LCSC Part Number: C93943
R99 R108 R117 R126 = RT0402BRD071K65L: RES SMD 1.65KOHM 0.1% 1/16W 0402; Manufacturer: Yageo; Item Type: Resistors; Supplier: Future Electronics; LCSC Part Number: C852615; Manufacturer Part Number: RT0402BRD071K65L; RoHS: Yes; Stock: 10000; Pricing: 10000=0.0185, 20000=0.0182, 30000=0.0181, 40000=0.018, 50000=0.0176 (USD); ComponentLink1URL: https://datasheet.ciiva.com/2582/pyu-rt-1-to-0-05-rohs-l-5-2582209.pdf?src-supplier=Digikey; ComponentLink1Description: https://datasheet.ciiva.com/2582/pyu-rt-1-to-0-05-rohs-l-5-2582209.pdf?src-supplier=Digikey
U9 U12 U13 U16 U17 U20 U21 U24 = TLP2361(TPL,E(T: 15Mbit/s 80ns 2.7V~5.5V 20kV/us DC SO-5 Logic Output Optoisolators ROHS; Manufacturer: Toshiba; Supplier: Arrow Electronics; LCSC Part Number: C107626; Manufacturer Part Number: TLP2361(TPL,E(T; RoHS: No; Stock: 15000; Pricing: 3000=0.3233, 6000=0.3199, 9000=0.3167, 12000=0.3136, 15000=0.3102, 30000=0.3071 (USD); ComponentLink1URL: https://datasheet.octopart.com/TLP2361%28TPL%2CE%28T-Toshiba-datasheet-62094047.pdf?src-supplier=TME; ComponentLink1Description: https://datasheet.octopart.com/TLP2361%28TPL%2CE%28T-Toshiba-datasheet-62094047.pdf?src-supplier=TME; Item Type: Optoisolator
U10 U14 U18 U22 = TLV9001IDCKR: IC CMOS 1 CIRCUIT SC70-5; Manufacturer: Texas Instruments; Number of Channels: 1; Slew Rate: 2V/µs; Gain Bandwidth Product: 1MHz; Input Bias Current: 5pA; Input Offset Voltage (Vos): 400uV; Operating Supply Current: 60uA; Output Current per Channel: 40mA; Supplier: Mouser; Supplier Part Number: 595-TLV9001IDCKR; Manufacturer Part Number: TLV9001IDCKR; RoHS: Yes; Item Type: IC; Stock: 13115; Pricing: 1=0.47, 10=0.348, 50=0.348, 100=0.194, 1000=0.146, 10000=0.117 (USD); Mounting Technology: Surface Mount; Min Operating Temperature: -40°C; Max Operating Temperature: 125°C; Packaging: Cut Tape; Number of Circuits: 1; Series: -; RoHS Compliant: Yes; ComponentLink1URL: http://www.ti.com/lit/ds/symlink/tlv9001.pdf?src-supplier=Digikey; ComponentLink1Description: http://www.ti.com/lit/ds/symlink/tlv9001.pdf?src-supplier=Digikey; LCSC Part Number: C398362
U11 U15 U19 U23 = PC817C: 70V 5kV 50mA 100mV@1mA,20mA 1 6V 1.2V DC SMD-4 Transistor Output Optocoupler ROHS; Manufacturer: Slkor; Item Type: IC; Manufacturer Part Number: PC817C; Package: SMD-4; LCSC Part Number: C2936043; ComponentLink1Description: LCSC; ComponentLink1URL: https://www.lcsc.com/product-detail/Transistor-Output-Optocoupler_Slkor-SLKORMICRO-Elec-PC817C_C2936043.html

## Nets that join several sheets
3V3: Power-Sheet (D5.2 F1.2 R9.1), USB-Sheet (R62.2 R63.2 R64.2 R65.2), Comms-Sheet (7 pins), Controller-Sheet-1 (12 pins), Controller-Sheet-2 (7 pins), BLDC-Driver-Sheet (16 pins)
5V: Power-Sheet (13 pins), USB-Sheet (U5.5), Comms-Sheet (10 pins), Controller-Sheet-2 (R60.2), BLDC-Driver-Sheet (16 pins)
24V: Power-Sheet (13 pins), BLDC-Driver-Sheet (16 pins)
GND: Power-Sheet (34 pins), USB-Sheet (13 pins), Comms-Sheet (22 pins), Controller-Sheet-1 (15 pins), Controller-Sheet-2 (16 pins), BLDC-Driver-Sheet (60 pins)
SHGND: Power-Sheet (J2.3), USB-Sheet (J5.S1 J5.S2 J5.S3 J5.S4)
485_DIN_1: Comms-Sheet (U8.4), Controller-Sheet-2 (R17.2)
485_ROUT_1: Comms-Sheet (U8.1), Controller-Sheet-2 (R15.2)
ADC_PA3: Controller-Sheet-2 (R19.2), BLDC-Driver-Sheet (D15.2 R95.2 U10.4)
ADC_PA4: Controller-Sheet-2 (R21.2), BLDC-Driver-Sheet (D18.2 R104.2 U14.4)
ADC_PA5: Controller-Sheet-2 (R23.2), BLDC-Driver-Sheet (D21.2 R113.2 U18.4)
ADC_PA6: Controller-Sheet-2 (R25.2), BLDC-Driver-Sheet (D24.2 R122.2 U22.4)
CAN1_RXD: Comms-Sheet (R79.1), Controller-Sheet-2 (R38.1)
CAN1_SHDN: Comms-Sheet (R82.1), Controller-Sheet-2 (R57.2)
CAN1_STB: Comms-Sheet (R73.1), Controller-Sheet-2 (R18.1)
CAN1_TXD: Comms-Sheet (R74.1), Controller-Sheet-2 (R40.1)
DI_PC0: Controller-Sheet-2 (R44.2), BLDC-Driver-Sheet (U12.5)
DI_PC1: Controller-Sheet-2 (R45.2), BLDC-Driver-Sheet (U16.5)
DI_PC2: Controller-Sheet-2 (R46.2), BLDC-Driver-Sheet (U20.5)
DI_PC3: Controller-Sheet-2 (R48.2), BLDC-Driver-Sheet (U24.5)
DO_PA7: Controller-Sheet-2 (R27.2), BLDC-Driver-Sheet (R96.1)
DO_PA8: Controller-Sheet-2 (R29.2), BLDC-Driver-Sheet (R105.1)
DO_PB1: Comms-Sheet (R87.1 U8.2 U8.3), Controller-Sheet-2 (R16.1)
DO_PB6: Controller-Sheet-2 (R26.1), BLDC-Driver-Sheet (R103.1)
DO_PB7: Controller-Sheet-2 (R28.1), BLDC-Driver-Sheet (R112.1)
DO_PB8: Controller-Sheet-2 (R30.1), BLDC-Driver-Sheet (R121.1)
DO_PC10: Controller-Sheet-2 (R54.2), BLDC-Driver-Sheet (R114.1)
DO_PC11: Controller-Sheet-2 (R55.2), BLDC-Driver-Sheet (R123.1)
DO_PD2: Controller-Sheet-2 (R47.1), BLDC-Driver-Sheet (R94.1)
LED1_DIN: Comms-Sheet (LED6.4), Controller-Sheet-2 (R61.2)
LPTIM1_CH1_PC12: Controller-Sheet-2 (R56.2), BLDC-Driver-Sheet (R118.1)
MOT1_SPEED: Controller-Sheet-2 (R50.2), BLDC-Driver-Sheet (R91.1)
MOT2_SPEED: Controller-Sheet-2 (R42.2), BLDC-Driver-Sheet (R100.1)
MOT3_SPEED: Controller-Sheet-2 (R13.2), BLDC-Driver-Sheet (R109.1)
USB_FS_N: USB-Sheet (U6.1), Controller-Sheet-2 (R36.2)
USB_FS_OVCR: USB-Sheet (LED4.2 R63.1 U5.3), Controller-Sheet-2 (R35.2)
USB_FS_P: USB-Sheet (U6.3), Controller-Sheet-2 (R37.2)
USB_FS_PWR_EN: USB-Sheet (R65.1 U5.4), Controller-Sheet-2 (R31.2)
VBUS_DET: USB-Sheet (R67.1 R69.2), Controller-Sheet-2 (R49.2)